# Altium schematic sheet usb_uart_esp32c5.SchDoc
size A; SheetNumber: 7; SheetTotal: 7
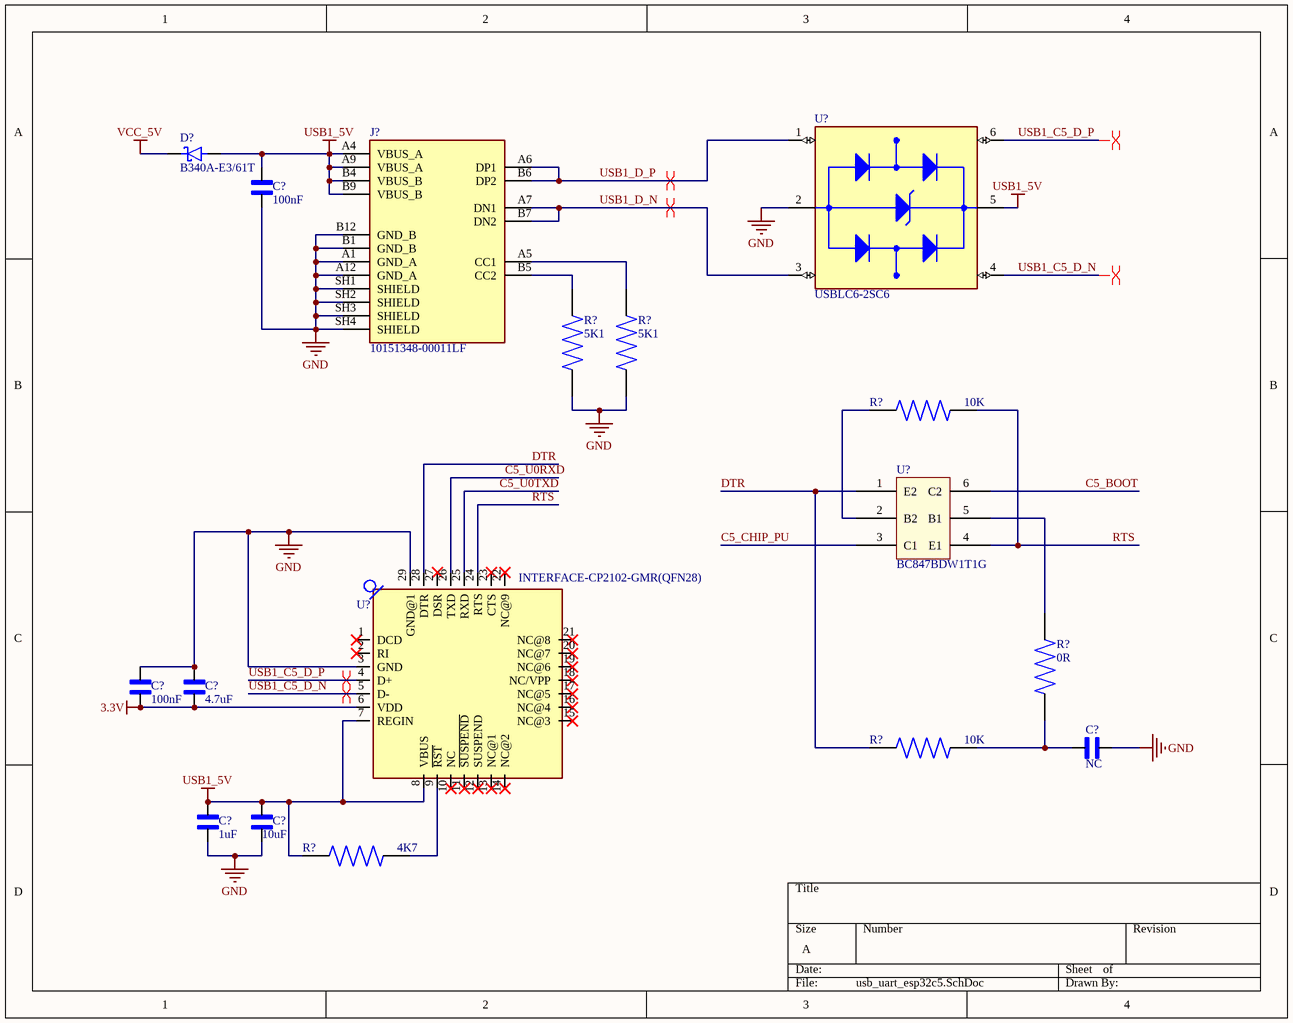
[diagram p0: usb_uart_esp32c5.SchDoc]

## Parts
(Parts that share a designator on the sheet are numbered #1, #2 ... from top to bottom, then left to right.)
C?#1  100nF  [CAPC1608X94N]
C?#2  100nF  [CAPC1608X94N]
C?#3  4.7uF  [CAPC1608X94N]
C?#4  NC  [CAPC1608X94N]
C?#5  1uF  [CAPC1608X94N]
C?#6  10uF  [CAPC1608X94N]
D?  B340A-E3/61T  [DIOM5126X229N]
J?  10151348-00011LF  [AMPHENOL_10151348-00011LF]
R?#1  5K1  [RES_ERJU02F5102X]
R?#2  5K1  [RES_ERJU02F5102X]
R?#3  10K  [RES_ERJU02F5102X]
R?#4  0R  [RES_ERJU02F5102X]
R?#5  10K  [RES_ERJU02F5102X]
R?#6  4K7  [RES_ERJU02F5102X]
U?#1  USBLC6-2SC6  [USBLC6-2SC6]
U?#2  BC847BDW1T1G  [SOT65P210X110-6N]
U?#3  INTERFACE-CP2102-GMR(QFN28)  [QFN28G_0.5-5X5MM]

## Nets
3.3V: C?#2.1 C?#3.1 U?#3.6(VDD)
GND: C?#1.1 C?#2.2 C?#3.2 C?#4.1 C?#5.2 C?#6.2 J?.A1(GND_A) J?.A12(GND_A) J?.B1(GND_B) J?.B12(GND_B) J?.SH1(SHIELD) J?.SH2(SHIELD) J?.SH3(SHIELD) J?.SH4(SHIELD) R?#1.1 R?#2.1 U?#1.2(GND) U?#3.3(GND) U?#3.29(GND@1)
USB1_5V: C?#1.2 C?#5.1 C?#6.1 D?.A J?.A4(VBUS_A) J?.A9(VBUS_A) J?.B4(VBUS_B) J?.B9(VBUS_B) R?#6.2 U?#1.5(VBUS) U?#3.7(REGIN) U?#3.8(VBUS)
VCC_5V: D?.C
C5_BOOT: U?#2.6(C2)
C5_CHIP_PU: U?#2.3(C1)
C5_U0RXD: U?#3.26(TXD)
C5_U0TXD: U?#3.25(RXD)
DTR: R?#5.2 U?#2.1(E2) U?#3.28(DTR)
RTS: R?#3.1 U?#2.4(E1) U?#3.24(RTS)
USB1_C5_D_N: U?#1.4(I/O2_OUT) U?#3.5(D-)
USB1_C5_D_P: U?#1.6(I/O1_OUT) U?#3.4(D+)
USB1_D_N: J?.A7(DN1) J?.B7(DN2) U?#1.3(I/O2_IN)
USB1_D_P: J?.A6(DP1) J?.B6(DP2) U?#1.1(I/O1_IN)
NetC?#4_2: C?#4.2 R?#4.2 R?#5.1
NetJ?_A5: J?.A5(CC1) R?#2.2
NetJ?_B5: J?.B5(CC2) R?#1.2
NetR?#3_2: R?#3.2 U?#2.2(B2)
NetR?#4_1: R?#4.1 U?#2.5(B1)
NetR?#6_1: R?#6.1 U?#3.9(~{RST})

Not connected (* = marked no-connect by the designer): U?#3 1(DCD)* 2(RI)* 10(NC)* 11(~{SUSPEND})* 12(SUSPEND)* 13(NC@1)* 14(NC@2)* 15(NC@3)* 16(NC@4)* 17(NC@5)* 18(NC/VPP)* 19(NC@6)* 20(NC@7)* 21(NC@8)* 22(NC@9)* 23(CTS)* 27(DSR)*

## Layout directives
differential pair: USB1_C5_D_N, USB1_C5_D_P, USB1_D_N, USB1_D_P

## Library data of the parts
C?#1-C?#6 = cap_0603_VJ0603D3R9DXCAP: cap 0603 (1608 Metric); MF: Vishay Vitramon; SnapEDA_Link: https://www.snapeda.com/parts/VJ0603D3R9DXCAP/Vishay/view-part/?ref=snap; Package: 1608 Vishay Vitramon; Value: *; MP: VJ0603D3R9DXCAP; Check_prices: https://www.snapeda.com/parts/VJ0603D3R9DXCAP/Vishay/view-part/?ref=eda
D? = B340A-E3/61T: Diode Schottky 40 V 3A Surface Mount DO-214AC (SMA); MF: Vishay Semiconductor; SnapEDA_Link: https://www.snapeda.com/parts/B340A-E3/61T/Vishay/view-part/?ref=snap; Package: DO-214 Vishay Semiconductor; Value: *; MP: B340A-E3/61T; Check_prices: https://www.snapeda.com/parts/B340A-E3/61T/Vishay/view-part/?ref=eda
J? = 10151348-00011LF: USB Type C Receptacle T/H 14Pin Upright; MF: Amphenol ICC (FCI); SnapEDA_Link: https://www.snapeda.com/parts/10151348-00011LF/Amphenol+ICC/view-part/?ref=snap; Package: None; Value: *; MP: 10151348-00011LF; Check_prices: https://www.snapeda.com/parts/10151348-00011LF/Amphenol+ICC/view-part/?ref=eda
R?#1-R?#6 = res_0402_ERJU02F5102X: Availability: Unavailable; MP: ERJU02F5102X; Price: None; Package: None; Value: *
U?#1 = USBLC6-2SC6: 17V Clamp 5A (8/20Âµs) Ipp Tvs Diode Surface Mount SOT-23-6; MF: STMicroelectronics; Value: *; SnapEDA_Link: https://www.snapeda.com/parts/USBLC6-2SC6/STMicroelectronics/view-part/?ref=snap; Check_prices: https://www.snapeda.com/parts/USBLC6-2SC6/STMicroelectronics/view-part/?ref=eda; Purchase-URL: https://pricing.snapeda.com/search/part/USBLC6-2SC6/?ref=eda; Price: None; Availability: In Stock; Package: SOT-23-6 STMicroelectronics; MP: USBLC6-2SC6
U?#2 = BC847BDW1T1G: Bipolar (BJT) Transistor Array 2 NPN (Dual) 45V 100mA 100MHz 380mW Surface Mount SC-88/SC70-6/SOT-363; MF: onsemi; SnapEDA_Link: https://www.snapeda.com/parts/BC847BDW1T1G/Onsemi/view-part/?ref=snap; Package: SC-88-6 ON Semiconductor; Value: *; MP: BC847BDW1T1G; Check_prices: https://www.snapeda.com/parts/BC847BDW1T1G/Onsemi/view-part/?ref=eda
U?#3 = INTERFACE-CP2102-GMR(QFN28): USB Bridge, USB to UART USB 2.0 UART Interface 28-QFN (5x5); MF: Silicon; Price: None; Availability: In Stock; MP: CP2102-GMR; Package: VFQFN-28 Vishay Siliconix; SnapEDA_Link: https://www.snapeda.com/parts/CP2102-GMR/Silicon+Labs/view-part/?ref=snap; Check_prices: https://www.snapeda.com/parts/CP2102-GMR/Silicon+Labs/view-part/?ref=eda; Value: *; Purchase-URL: https://pricing.snapeda.com/search/part/CP2102-GMR/?ref=eda